# EasyEDA Pro project 小车pcb.epro

# Schematic Schematic1
Board Name: Board1; Create Date: 2025-04-14; Page Name: P1; Project Name: 校赛小车; Schematic Name: Schematic1; Update Date: 2025-05-07; Company: 广师大开拓者ONE; Page Size: A4; Version: V1.0
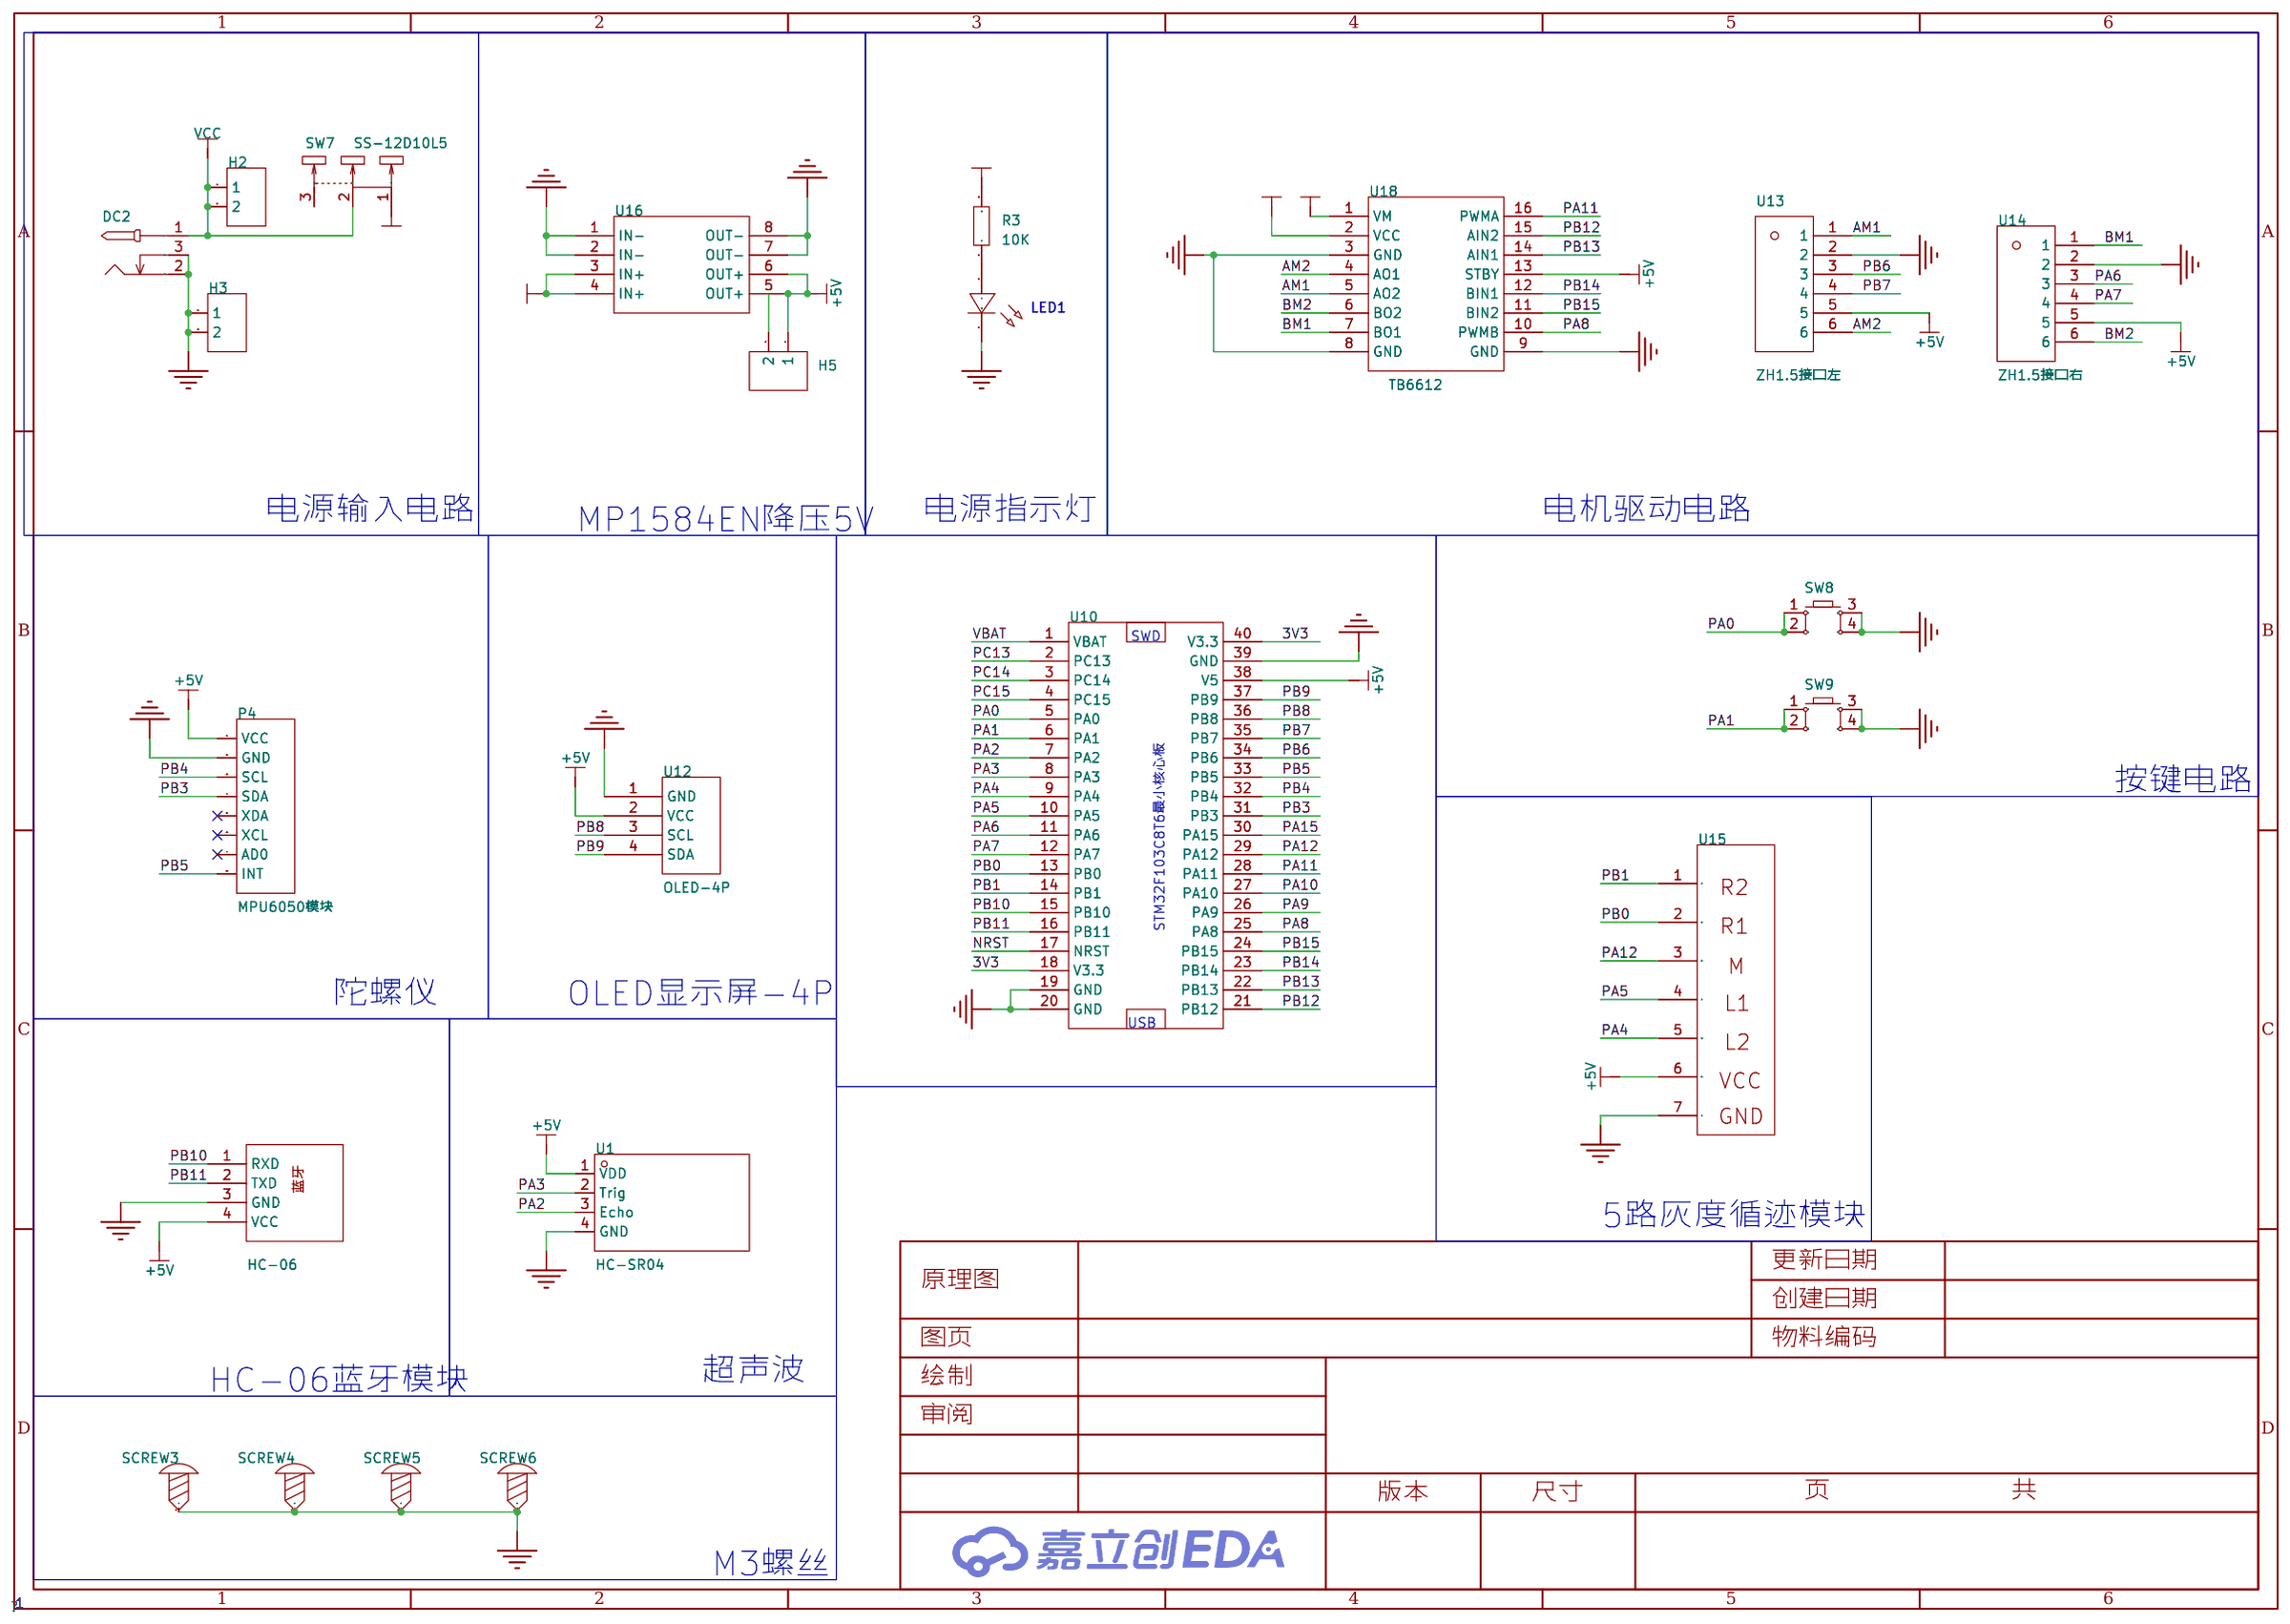
[diagram p0: schematic sheet]

## Parts
DC2  -  [DC-005_2.5]
H2  -  [HDR-TH_2P-P2.54-V-F]
H3  -  [HDR-TH_2P-P2.54-V-F]
H5  -  [HDR-TH_2P-P2.54-V-F]
LED1  -  [LED_0805]
P4  MPU6050模块  [MPU6050模块]
R3  10K  [R0805]
SCREW3  -  [M3螺丝]
SCREW4  -  [M3螺丝]
SCREW5  -  [M3螺丝]
SCREW6  -  [M3螺丝]
SW7  SS-12D10L5  [SW-TH_SS-12D10L5]
SW8  -  [SW-TH_4P-L6.0-W6.0-P4.50-LS6.5]
SW9  -  [SW-TH_4P-L6.0-W6.0-P4.50-LS6.5]
U1  HC-SR04  [HC-SR04]
U10  -  [STM32F103C8T6]
U11  HC-06  [蓝牙-P4-USART]
U12  OLED-4P  [I2C - OLED 0.96" 128X64]
U13  ZH1.5接口左  [ZH1.5*6]
U14  ZH1.5接口右  [ZH1.5*6]
U15  -  [5路灰度传感器]
U16  -  [MP1584EN降压模块]
U18  TB6612  [TB6612电机驱动模块]

## Library data of the parts
DC2 = DC-005_2.5: Supplier Footprint: 插件
H2 H3 H5 = HDR-F_2.54_1x2P: Supplier Part: C49661; Supplier Footprint: 插件
LED1 = LED_0805-G: Supplier Footprint: 0805
P4 = MPU6050模块
R3 = Res_0805: Supplier Footprint: 0805
SCREW3-SCREW6 = M3螺丝: Supplier Footprint: 插件
SW7 = SS-12D10L5: 电路结构:单刀双掷;安装方式:直插;开关颜色:黑色;额定电流(DC):3A;额定电压(DC):125V;额定电流(AC):3A;额定电压(AC):125V;机械寿命:1万次;; LCSC Part Name: 柄长5mm 直插双档 滑动开关; Supplier Part: C319012; Manufacturer: XKB Connectivity(中国星坤); Supplier Footprint: 插件; JLCPCB Part Class: 扩展库; Datasheet: https://atta.szlcsc.com/upload/public/pdf/source/20211009/D6412F37AABE6F9459A6EE7FA4DAEADB.pdf; Supplier: LCSC; Circuit: 单刀双掷; Actuator Style: 矩形柱状; Pin Style: PC引脚; Switch Length: 13mm; Switch Width: 6.8mm; Switch Height: 6.4mm; Mounting Style: 直插; Actuator Color: 黑色; Current Rating (DC): 3A; Voltage Rating (DC): 125V; Current Rating (AC): 3A; Voltage Rating (AC): 125V; Mechanical Life: 1万次; Operating Temperature: -40℃~+85℃
SW8 SW9 = Key_TH_6x6x6: 触点电流:50mA;额定电压(DC):12V;绝缘电阻:100MΩ;电路结构:单刀单掷;安装方式:直插;按钮形状:圆形按钮;按钮/盖帽颜色:黑色;作用力:260gf@±30gf;工作温度:-25℃~+70℃;引脚样式:PC引脚;开关长度:6mm;开关宽度:6mm;开关高度:6mm;带支架:否;; Supplier Part: C2837516; Supplier Footprint: 插件
U1 = HC-SR04: _: 3
U10 = STM32F103C8T6最小核心板
U11 = 蓝牙JDY_31
U12 = OLED-4P
U13 U14 = ZH1.5
U15 = 5路灰度传感器: _: 3
U16 = MP1584EN降压模块: _: 3
U18 = TB6612电机驱动模块

## Nets
3V3: U10.18(V3.3) U10.40(V3.3)
12V: R3.2 SW7.1 U16.3(IN+) U16.4(IN+) U18.1(VM)
+5V: H5.1 H5.2 P4.1(VCC) U1.1(VDD) U10.38(V5) U11.4(VCC) U12.2(VCC) U13.5 U14.5 U15.6 U16.5(OUT+) U16.6(OUT+) U18.2(VCC) U18.13(STBY)
GND: DC2.2 DC2.3 H3.1 H3.2 LED1.1(C) P4.2(GND) SCREW3.1 SCREW4.1 SCREW5.1 SCREW6.1 SW8.3 SW8.4 SW9.3 SW9.4 U1.4(GND) U10.19(GND) U10.20(GND) U10.39(GND) U11.3(GND) U12.1(GND) U13.2 U14.2 U15.7 U16.1(IN-) U16.2(IN-) U16.7(OUT-) U16.8(OUT-) U18.3(GND) U18.8(GND) U18.9(GND)
VBAT: U10.1(VBAT)
VCC: DC2.1(4) H2.1 H2.2 SW7.2
AM1: U13.1 U18.5(AO2)
AM2: U13.6 U18.4(AO1)
BM1: U14.1 U18.7(BO1)
BM2: U14.6 U18.6(BO2)
NRST: U10.17(NRST)
PA0: SW8.1 SW8.2 U10.5(PA0)
PA1: SW9.1 SW9.2 U10.6(PA1)
PA2: U1.3(Echo) U10.7(PA2)
PA3: U1.2(Trig) U10.8(PA3)
PA4: U10.9(PA4) U15.5
PA5: U10.10(PA5) U15.4
PA6: U10.11(PA6) U14.3
PA7: U10.12(PA7) U14.4
PA8: U10.25(PA8) U18.10(PWMB)
PA9: U10.26(PA9)
PA10: U10.27(PA10)
PA11: U10.28(PA11) U18.16(PWMA)
PA12: U10.29(PA12) U15.3
PA15: U10.30(PA15)
PB0: U10.13(PB0) U15.2
PB1: U10.14(PB1) U15.1
PB3: P4.4(SDA) U10.31(PB3)
PB4: P4.3(SCL) U10.32(PB4)
PB5: P4.8(INT) U10.33(PB5)
PB6: U10.34(PB6) U13.3
PB7: U10.35(PB7) U13.4
PB8: U10.36(PB8) U12.3(SCL)
PB9: U10.37(PB9) U12.4(SDA)
PB10: U10.15(PB10) U11.1(RXD)
PB11: U10.16(PB11) U11.2(TXD)
PB12: U10.21(PB12) U18.15(AIN2)
PB13: U10.22(PB13) U18.14(AIN1)
PB14: U10.23(PB14) U18.12(BIN1)
PB15: U10.24(PB15) U18.11(BIN2)
PC13: U10.2(PC13)
PC14: U10.3(PC14)
PC15: U10.4(PC15)
$1N9017: LED1.2(A) R3.1

Not connected (* = marked no-connect by the designer): P4 5(XDA)* 6(XCL)* 7(AD0)*; SW7 3

## Notes on the sheet
- 电源输入电路
- 电源指示灯
- 电机驱动电路
- MP1584EN降压5V
- 按键电路
- 陀螺仪
- OLED显示屏-4P
- 5路灰度循迹模块
- 超声波
- HC-06蓝牙模块
- M3螺丝

# Board PCB1
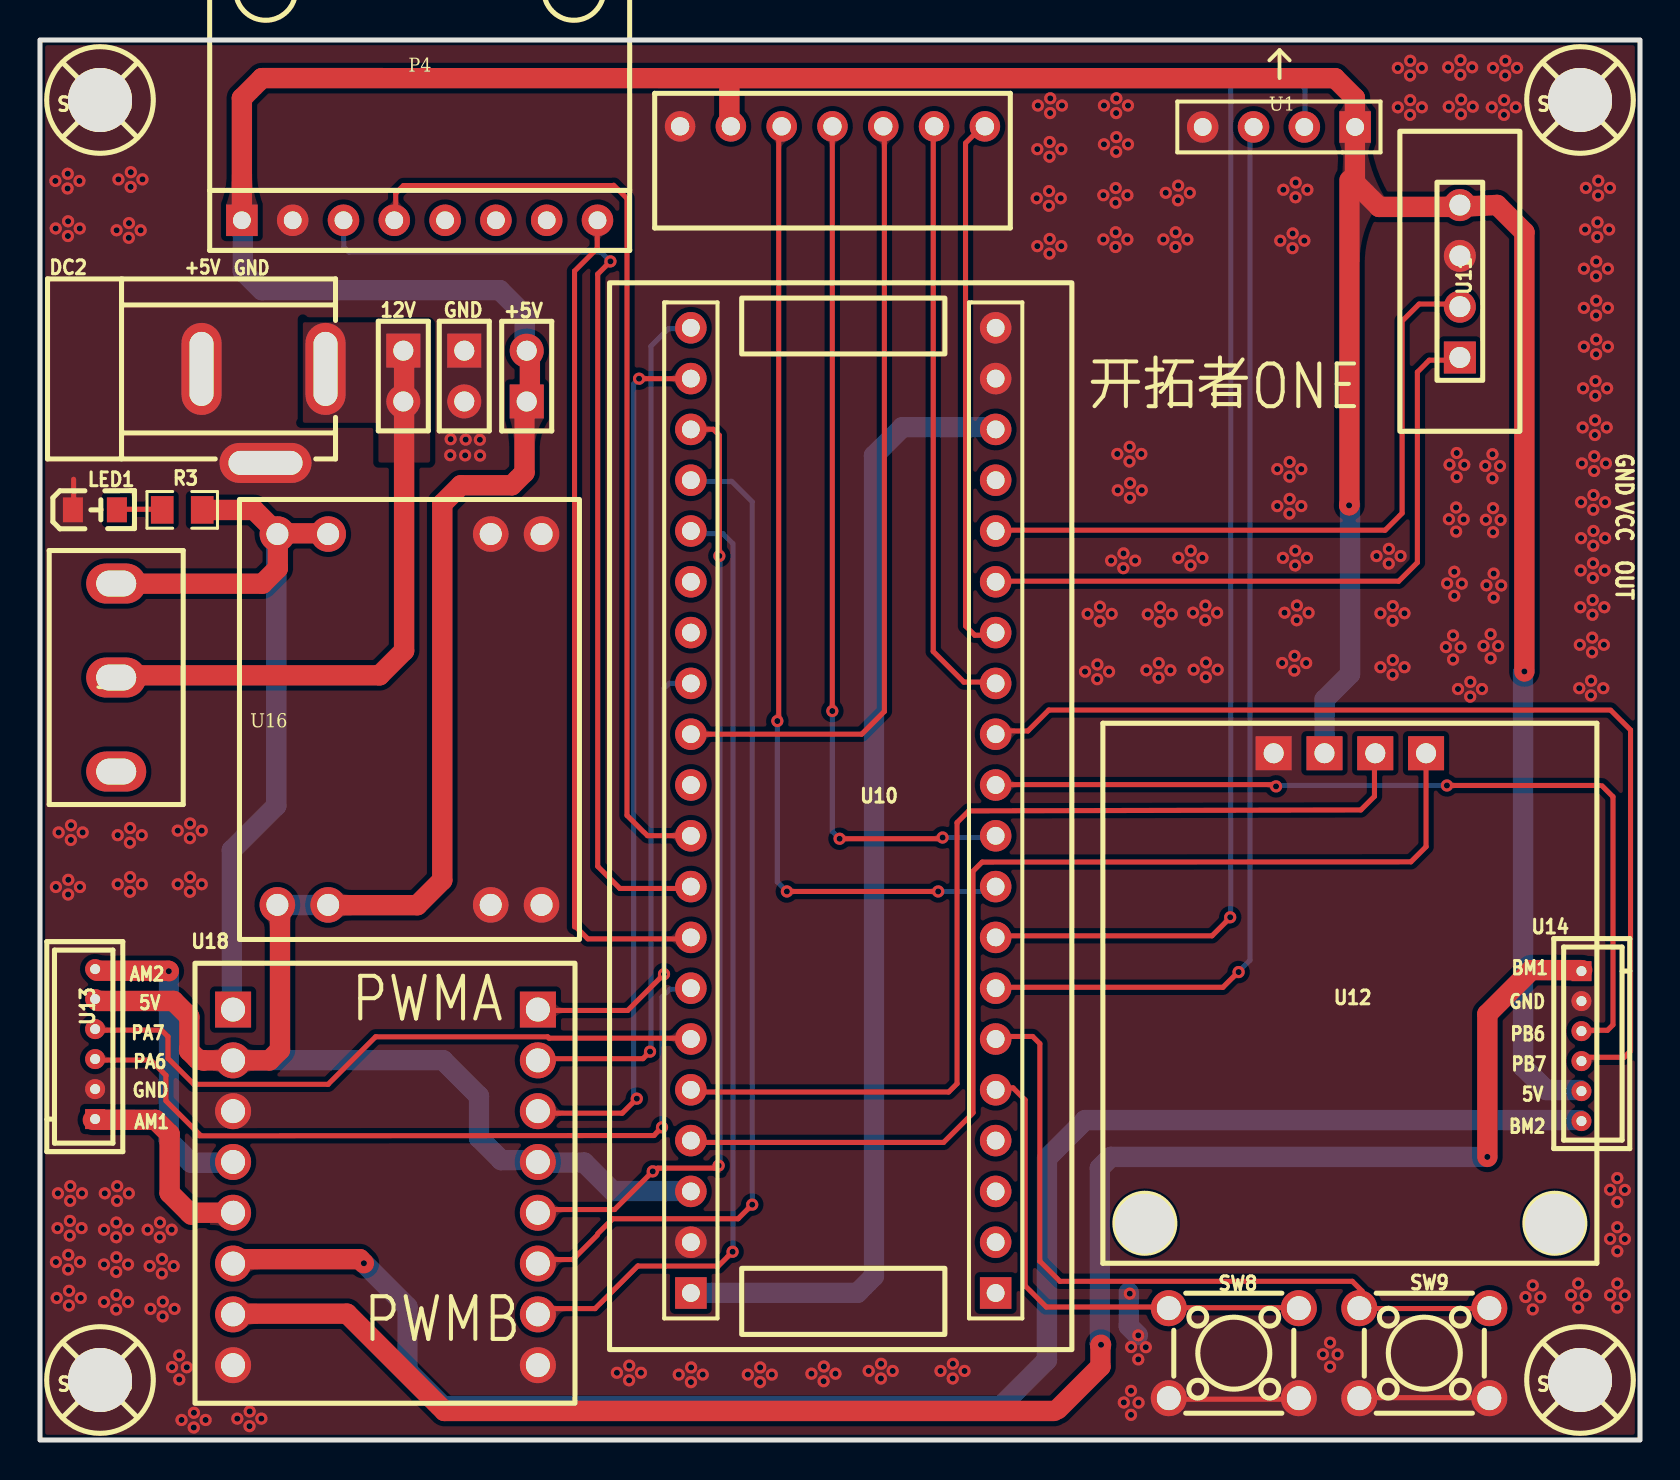
[diagram p1: board, top side]
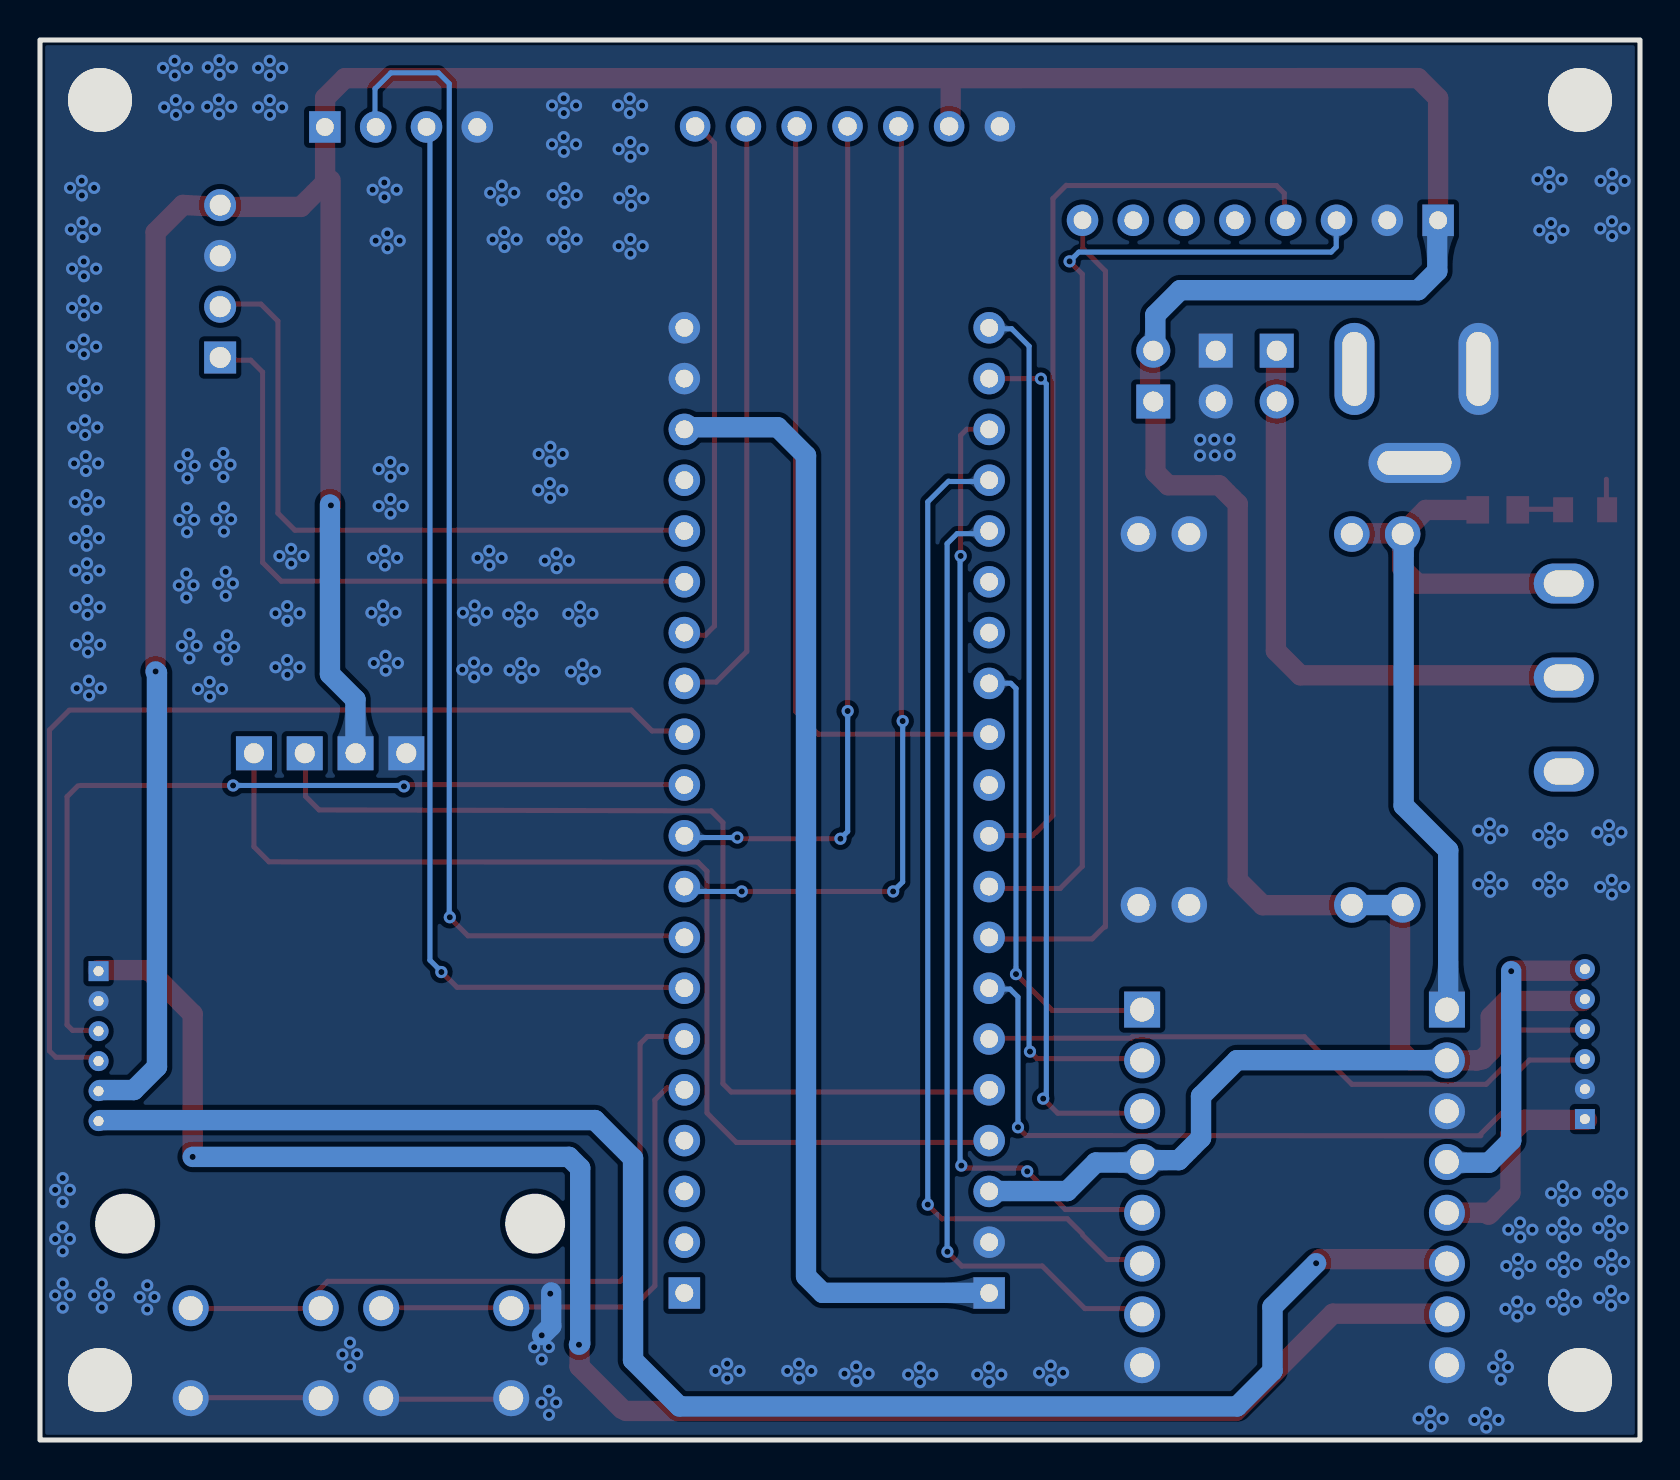
[diagram p2: board, bottom side, seen from below]

Outline 80 x 70 mm; copper layers: Top Layer, Bottom Layer. Coordinates in mm from the lower left corner of the outline.
Outline path: rectangle 0,70 80,0
Stack: Top Layer 0.035mm / Dielectric1 1.51mm FR4 er 4.5 / Bottom Layer 0.035mm

## Design rules (mm)
template: 自定义配置
spacing copperThickness1oz (default): track to track 0.102, other pairs 0.152 to 0.3
spacing copperThickness2oz: track to track 0.203, other pairs 0.152 to 0.3
track width copperThickness1oz (default): min 0.127, default 0.254, max 2.54
track width copperThickness2oz: min 0.203, default 0.254, max 2.54
track width 加粗: min 0.127, default 1.016, max 2.54
differential pair differentialPair (default): width min 0.127, default 0.254, max 2.54; gap min 0.152, default 0.152
via viaSize (default): diameter min 0.5, default 0.61, max 10; hole min 0.3, default 0.305, max 6.299
net 3V3 uses 加粗
net VBAT uses 加粗
net VCC uses 加粗
net GND uses 加粗
net +5V uses 加粗

## Placement (name value [footprint] x y rotation side)
12V  -  [HDR-TH_2P-P2.54-V-F]  18.17 53.2 270 top
+5V  -  [HDR-TH_2P-P2.54-V-F]  24.34 53.19 90 top
DC2  -  [DC-005_2.5]  11.05 53.24 180 top
GND  -  [HDR-TH_2P-P2.54-V-F]  21.21 53.2 270 top
LED1  -  [LED_0805]  2.79 46.5 0 top
P4  -  [MPU6050模块]  27.87 60.99 90 top
R3  10K  [R0805]  7.11 46.5 0 top
SCREW3  -  [M3螺丝]  77 67 0 top
SCREW4  -  [M3螺丝]  77 3 0 top
SCREW5  -  [M3螺丝]  3 67 0 top
SCREW6  -  [M3螺丝]  3 3 0 top
SW7  SS-12D10L5  [SW-TH_SS-12D10L5]  3.81 38.12 270 top
SW8  -  [SW-TH_4P-L6.0-W6.0-P4.50-LS6.5]  59.69 4.34 0 top
SW9  -  [SW-TH_4P-L6.0-W6.0-P4.50-LS6.5]  69.22 4.34 0 top
U1  -  [HC-SR04]  61.98 65.68 180 top
U10  -  [STM32F103C8T6]  47.78 31.44 180 top
U11  HC-06  [蓝牙-P4-USART]  70.99 57.94 90 top
U12  OLED-4P  [I2C - OLED 0.96" 128X64]  53.14 35.84 0 top
U13  ZH1.5接口左  [ZH1.5*6]  2.76 16.05 180 top
U14  ZH1.5接口右  [ZH1.5*6]  77.07 23.44 0 top
U15  -  [5路灰度传感器]  39.62 63.65 270 top
U16  -  [MP1584EN降压模块]  18.47 36.03 270 top
U18  TB6612  [TB6612电机驱动模块]  7.75 23.84 0 top

## Footprints (pads in the part's own frame, mm; a bottom-side part is the same pattern mirrored in y, then rotated)
5路灰度传感器
  round 1.524 hole 0.914: 1(-2.032,7.62) 2(-2.032,5.08) 3(-2.032,2.54) 4(-2.032,0) 5(-2.032,-2.54) 6(-2.032,-5.08) 7(-2.032,-7.62)
DC-005_2.5
  oval 2x4.6 hole 1.2x3.7: 1(-3.227,-0.318) 2(2.973,-0.318)
  oval 4.6x2 hole 3.7x1.2: 3(-0.227,4.382)
HC-SR04
  rect 1.575x1.575 hole 0.889: 1(-3.78,0.03)
  round 1.575 hole 0.889: 2(-1.24,0.03) 3(1.3,0.03) 4(3.84,0.03)
HDR-TH_2P-P2.54-V-F
  rect 1.7x1.7 hole 1: 1(-1.27,0)
  round 1.7 hole 1: 2(1.27,0)
I2C - OLED 0.96" 128X64
  rect 1.8x1.7 hole 1: 1(8.54,-1.5) 2(11.08,-1.5) 3(13.62,-1.5) 4(16.16,-1.5)
LED_0805
  rect 1x1.25 smd: 1(-1.15,0.005) 2(1.05,0.005)
M3螺丝
  round 3.2 hole 3.2: 1(0,0)
MP1584EN降压模块
  round 1.778 hole 1.1: 1(-9.271,6.604) 2(-9.271,4.064) 3(-9.271,-4.064) 4(-9.271,-6.604) 5(9.271,-6.604) 6(9.271,-4.064) 7(9.271,4.064) 8(9.271,6.604)
MPU6050模块
  rect 1.575x1.575 hole 0.889: 1(0,17.78)
  round 1.575 hole 0.889: 2(0,15.24) 3(0,12.7) 4(0,10.16) 5(0,7.62) 6(0,5.08) 7(0,2.54) 8(0,0)
R0805
  rect 1.133x1.377 smd: 1(-1,0) 2(1,0)
STM32F103C8T6
  rect 1.575x1.575 hole 0.889: 1(0,24.093) 40(15.24,24.093)
  round 1.575 hole 0.889: 2(0,21.553) 3(0,19.013) 4(0,16.473) 5(0,13.933) 6(0,11.393) 7(0,8.853) 8(0,6.313) 9(0,3.773) 10(0,1.233) 11(0,-1.307) 12(0,-3.847) 13(0,-6.387) 14(0,-8.927) 15(0,-11.467) 16(0,-14.007) 17(0,-16.547) 18(0,-19.087) 19(0,-21.627) 20(0,-24.167) 21(15.24,-24.167) 22(15.24,-21.627) 23(15.24,-19.087) 24(15.24,-16.547) 25(15.24,-14.007) 26(15.24,-11.467) 27(15.24,-8.927) 28(15.24,-6.387) 29(15.24,-3.847) 30(15.24,-1.307) 31(15.24,1.233) 32(15.24,3.773) 33(15.24,6.313) 34(15.24,8.853) 35(15.24,11.393) 36(15.24,13.933) 37(15.24,16.473) 38(15.24,19.013) 39(15.24,21.553)
SW-TH_4P-L6.0-W6.0-P4.50-LS6.5
  round 1.8 hole 1.2: 1(-3.25,2.25) 2(3.25,2.25) 3(-3.25,-2.25) 4(3.25,-2.25)
SW-TH_SS-12D10L5
  oval 2x3 hole 1.3x2: 1(-4.7,0) 2(0,0) 3(4.7,0)
TB6612电机驱动模块
  rect 1.8x1.8 hole 1.2: 1(1.905,-2.315) 16(17.145,-2.315)
  round 1.8 hole 1.2: 2(1.905,-4.855) 3(1.905,-7.395) 4(1.905,-9.935) 5(1.905,-12.475) 6(1.905,-15.015) 7(1.905,-17.555) 8(1.905,-20.095) 9(17.145,-20.095) 10(17.145,-17.555) 11(17.145,-15.015) 12(17.145,-12.475) 13(17.145,-9.935) 14(17.145,-7.395) 15(17.145,-4.855)
ZH1.5*6
  rect 1x1 hole 0.5: 1(0,0)
  round 1 hole 0.5: 2(0,-1.498) 3(0,-3) 4(0,-4.498) 5(0,-6) 6(0,-7.498)
蓝牙-P4-USART
  rect 1.6x1.6 hole 1.05: 1(-3.81,0)
  round 1.6 hole 1.05: 2(-1.27,0) 3(1.27,0) 4(3.81,0)

## Nets
As in the schematic, except:
+5V: +5V.1 +5V.2 P4.1 U1.1 U10.38 U11.4 U12.2 U13.5 U14.5 U15.6 U16.5 U16.6 U18.2 U18.13
GND: DC2.2 DC2.3 GND.1 GND.2 LED1.1 P4.2 SCREW3.1 SCREW4.1 SCREW5.1 SCREW6.1 SW8.3 SW8.4 SW9.3 SW9.4 U1.4 U10.19 U10.20 U10.39 U11.3 U12.1 U13.2 U14.2 U15.7 U16.1 U16.2 U16.7 U16.8 U18.3 U18.8 U18.9
VCC: 12V.1 12V.2 DC2.1 SW7.2

Pads without a net: P4 5 6 7; SW7 3

## Via types
v1: diameter 0.61, hole 0.305, Top Layer to Bottom Layer, 422 vias

## Routing (per net, layer and track width the routed paths; a pad name or vN(x,y) marks a point on that pad's centre or on a via; arc(x,y) is an arc through that point)
3V3: length 56.9
  Bottom Layer w1.016: 47.59,50.64 43.12,50.64 41.7,49.22 41.7,8.19 ; 32.63,7.36 40.87,7.36 41.68,8.17
12V: length 41
  Top Layer w1.016: 8.18,46.5 10.71,46.5 11.89,45.32 ; 14.36,45.31 14.33,45.33 11.89,45.33 ; 11.89,45.05 11.89,43.58 11.12,42.82 4.26,42.82 4.11,42.96
  Bottom Layer w1.016: 9.68,21.63 9.59,21.72 9.59,29.49 11.82,31.72 11.82,45.35
+5V: length 256.3
  Top Layer w1.016: 24.49,52.12 24.49,54.48 ; 70.95,61.65 70.96,61.66 72.85,61.75 74.22,60.39 v1(74.22,38.43) ; 70.95,61.65 70.96,61.65 ; 70.95,61.65 66.96,61.65 65.77,62.84 ; 7.47,19.64 7.47,21.16 6.68,21.95 2.86,21.95 ; 11.82,26.9 12,26.72 12,19.51 11.47,18.98 U18.2 8.19,18.98 ; 65.74,65.86 65.74,67.1 64.75,68.09 11.1,68.09 10.09,67.09 P4.1 ; 7.45,19.55 7.45,19.46 7.88,19.04 8.19,18.98 ; 24.34,51.97 24.32,51.99 ; 65.74,65.63 65.74,62.99 ; 14.36,26.74 18.86,26.74 20.11,27.99 20.11,46.81 21.04,47.74 23.59,47.74 24.23,48.37 24.23,51.86 24.14,51.77 ; 34.5,67.95 34.47,67.92 34.47,65.71 ; v1(65.45,46.73) 65.47,46.75 65.47,62.99 ; 71.03,61.73 71.05,61.75 ; 8.19,18.98 8.12,18.98
  Bottom Layer w1.016: 11.72,26.75 14.32,26.75 14.47,26.9 ; v1(74.22,38.43) 74.15,38.36 74.15,18.66 75.31,17.5 77.01,17.5 ; 32.63,12.36 32.54,12.45 28.63,12.45 27.21,13.87 25.09,13.87 ; 9.61,18.99 20.15,18.99 21.95,17.19 21.95,15.1 23.06,13.99 24.85,13.99 ; 24.23,54.48 24.23,56.25 22.99,57.49 11.09,57.49 10.14,58.45 10.14,60.94 P4.1 ; 64.2,34.33 64.23,34.36 64.23,37.02 65.5,38.29 65.5,46.78
GND: length 17.1
  Top Layer w0.254: 56.17,2.04 62.78,2.04 62.86,2.12 ; 65.88,2.12 72.34,2.12 ; 1.86,46.54 1.68,46.71 1.68,48.03
  Bottom Layer w1.016: 54.9,5.24 54.44,5.7 54.44,7.38
  vias: v1(0.77,62.95) v1(0.78,60.58) v1(0.8,27.65) v1(0.8,8.9) v1(0.84,7.1) v1(0.93,30.38) v1(0.9,12.33) v1(0.88,10.6) v1(1.39,63.31) v1(1.38,62.58) v1(1.4,60.94) v1(1.4,60.2) v1(1.41,28.01) v1(1.41,27.27) v1(1.42,9.26) v1(1.41,8.52) v1(1.45,6.72) v1(1.54,30) v1(1.52,12.69) v1(1.51,11.96) v1(1.5,10.96) v1(1.49,10.22) v1(1.46,7.46) v1(1.55,30.74) v1(1.97,62.95) v1(1.99,60.58) v1(2,27.65) v1(2,8.9) v1(2.04,7.1) v1(2.13,30.38) v1(2.1,12.33) v1(2.08,10.6) v1(3.24,12.33) v1(3.2,10.51) v1(3.2,8.78) v1(3.2,6.9) v1(3.83,60.49) v1(3.85,11.96) v1(3.82,10.87) v1(3.81,10.14) v1(3.82,9.14) v1(3.81,8.4) v1(3.82,7.26) v1(3.81,6.52) v1(3.92,63.03) v1(3.89,30.24) v1(3.89,27.79) v1(3.86,12.69) v1(4.45,60.84) v1(4.44,60.11) v1(4.44,12.33) v1(4.4,10.51) v1(4.4,8.78) v1(4.4,6.9) v1(4.54,63.39) v1(4.53,62.65) v1(4.5,30.6) v1(4.5,29.86) v1(4.5,28.15) v1(4.5,27.41) v1(5.03,60.49) v1(5.12,63.03) v1(5.09,30.24) v1(5.09,27.79) v1(5.38,10.51) v1(5.48,8.7) v1(5.52,6.56) v1(6,10.87) v1(5.99,10.14) v1(6.1,9.06) v1(6.09,8.32) v1(6.14,6.92) v1(6.13,6.18) v1(6.58,10.51) v1(6.6,3.65) v1(6.69,8.7) v1(6.72,6.56) v1(6.89,30.47) v1(6.89,27.79) v1(6.96,4.23) v1(6.96,3.03) v1(7.08,1) v1(7.34,3.64) v1(7.5,30.83) v1(7.5,30.09) v1(7.5,28.15) v1(7.5,27.41) v1(7.7,1.36) v1(7.69,0.62) v1(8.09,30.47) v1(8.09,27.79) v1(8.28,1) v1(9.86,1.07) v1(10.48,1.43) v1(10.48,0.69) v1(11.07,1.07) v1(20.53,50.04) v1(20.51,49.24) v1(21.28,50.02) v1(21.26,49.23) v1(21.99,50.01) v1(22,49.22) v1(28.84,3.36) v1(29.46,3.72) v1(29.46,2.98) v1(30.05,3.36) v1(31.94,3.27) v1(32.55,2.89) v1(32.56,3.63) v1(33.14,3.27) v1(35.39,3.27) v1(36.01,3.63) v1(36,2.89) v1(36.59,3.27) v1(38.57,3.32) v1(39.19,3.68) v1(39.18,2.94) v1(39.77,3.32) v1(41.43,3.45) v1(42.04,3.08) v1(42.05,3.81) v1(42.64,3.45) v1(45.02,3.45) v1(45.64,3.81) v1(45.63,3.08) v1(46.23,3.45) v1(49.83,62.09) v1(49.9,66.72) v1(49.86,64.54) v1(49.86,59.69) v1(50.44,61.71) v1(50.51,67.08) v1(50.51,66.35) v1(50.48,64.9) v1(50.47,64.17) v1(50.45,62.45) v1(50.48,60.05) v1(50.47,59.32) v1(51.04,62.09) v1(51.1,66.72) v1(51.07,64.54) v1(51.07,59.69) v1(52.25,38.42) v1(52.38,41.31) v1(52.87,38.78) v1(52.86,38.04) v1(53,41.66) v1(52.99,40.93) v1(53.2,66.72) v1(53.2,64.78) v1(53.17,62.24) v1(53.17,60.03) v1(53.45,38.42) v1(53.56,43.97) v1(53.58,41.31) v1(53.82,67.08) v1(53.81,66.35) v1(53.82,65.14) v1(53.81,64.41) v1(53.79,62.6) v1(53.78,61.86) v1(53.79,60.39) v1(53.78,59.65) v1(53.86,49.3) v1(53.89,47.49) v1(54.18,44.33) v1(54.17,43.59) v1(54.19,1.88) v1(54.4,66.72) v1(54.4,64.78) v1(54.37,62.24) v1(54.37,60.03) v1(54.48,49.66) v1(54.47,48.92) v1(54.51,47.84) v1(54.5,47.11) v1(54.49,7.32) v1(54.55,4.65) v1(54.55,2.46) v1(54.55,1.26) v1(54.76,43.97) v1(54.91,5.23) v1(54.91,4.03) v1(54.93,1.87) v1(55.07,49.3) v1(55.09,47.49) v1(55.32,38.49) v1(55.29,4.64) v1(55.39,41.28) v1(55.94,38.85) v1(55.93,38.11) v1(56.01,41.64) v1(56,40.91) v1(56.17,60.03) v1(56.29,62.36) v1(56.52,38.49) v1(56.59,41.28) v1(56.79,60.39) v1(56.78,59.65) v1(56.91,62.72) v1(56.9,61.98) v1(56.92,44.11) v1(57.37,60.03) v1(57.49,62.36) v1(57.54,44.47) v1(57.53,43.73) v1(57.65,41.36) v1(57.68,38.52) v1(58.12,44.11) v1(58.27,41.72) v1(58.26,40.99) v1(58.3,38.88) v1(58.29,38.14) v1(58.85,41.36) v1(58.88,38.52) v1(61.86,48.54) v1(61.86,46.7) v1(62.01,59.97) v1(62.15,44.11) v1(62.1,38.85) v1(62.17,62.51) v1(62.23,41.36) v1(62.48,48.9) v1(62.47,48.17) v1(62.48,47.06) v1(62.47,46.32) v1(62.63,60.33) v1(62.62,59.59) v1(62.72,39.21) v1(62.72,38.47) v1(62.78,62.87) v1(62.78,62.14) v1(62.76,44.47) v1(62.76,43.73) v1(62.85,41.72) v1(62.84,40.99) v1(63.07,48.54) v1(63.07,46.7) v1(63.22,59.97) v1(63.35,44.11) v1(63.31,38.85) v1(63.37,62.51) v1(63.43,41.36) v1(64.14,4.29) v1(64.5,4.87) v1(64.5,3.67) v1(64.88,4.28) v1(66.83,44.2) v1(67.02,41.34) v1(67.02,38.64) v1(67.45,44.56) v1(67.44,43.82) v1(67.64,41.69) v1(67.63,40.96) v1(67.64,39) v1(67.63,38.26) v1(67.89,68.6) v1(67.89,66.63) v1(68.03,44.2) v1(68.22,41.34) v1(68.22,38.64) v1(68.51,68.96) v1(68.5,68.23) v1(68.51,66.99) v1(68.5,66.26) v1(69.09,68.6) v1(69.09,66.63) v1(70.29,39.65) v1(70.41,68.63) v1(70.44,66.66) v1(70.45,46.04) v1(70.35,42.83) v1(70.48,48.77) v1(70.71,43.41) v1(70.71,42.21) v1(70.65,40.23) v1(70.65,39.03) v1(70.84,49.35) v1(70.84,48.15) v1(70.81,46.62) v1(70.81,45.42) v1(70.9,37.55) v1(71.03,68.99) v1(71.02,68.26) v1(71.05,66.29) v1(71.03,39.64) v1(71.06,67.02) v1(71.09,42.82) v1(71.21,48.76) v1(71.18,46.03) v1(71.52,37.91) v1(71.51,37.17) v1(71.61,68.63) v1(71.64,66.66) v1(72.1,37.55) v1(72.17,39.71) v1(72.26,48.71) v1(72.29,46.01) v1(72.32,42.74) v1(72.53,40.29) v1(72.53,39.09) v1(72.65,68.6) v1(72.59,66.63) v1(72.62,49.29) v1(72.62,48.09) v1(72.65,46.59) v1(72.65,45.39) v1(72.68,43.32) v1(72.68,42.12) v1(72.91,39.7) v1(73,48.7) v1(73.03,46) v1(73.06,42.73) v1(73.21,66.99) v1(73.2,66.26) v1(73.27,68.96) v1(73.26,68.23) v1(73.79,66.63) v1(73.85,68.6) v1(74.28,7.15) v1(74.64,7.73) v1(74.64,6.53) v1(75.01,7.14) v1(76.55,7.24) v1(76.91,7.82) v1(76.91,6.62) v1(77.03,43.48) v1(77.01,41.64) v1(76.99,39.76) v1(76.96,37.59) v1(77.13,50.63) v1(77.09,48.83) v1(77.05,46.89) v1(77.05,45.09) v1(77.19,58.56) v1(77.19,56.61) v1(77.19,54.67) v1(77.15,52.59) v1(77.29,62.61) v1(77.25,60.52) v1(77.29,7.23) v1(77.55,37.23) v1(77.64,43.1) v1(77.63,42) v1(77.62,41.26) v1(77.61,40.12) v1(77.6,39.38) v1(77.56,37.97) v1(77.74,50.25) v1(77.71,49.19) v1(77.7,48.45) v1(77.67,47.25) v1(77.66,46.51) v1(77.67,45.45) v1(77.66,44.72) v1(77.65,43.84) v1(77.81,58.92) v1(77.8,58.19) v1(77.81,56.97) v1(77.8,56.23) v1(77.81,55.03) v1(77.8,54.29) v1(77.77,52.94) v1(77.76,52.21) v1(77.75,50.99) v1(77.91,62.96) v1(77.91,62.23) v1(77.87,60.88) v1(77.87,60.15) v1(78.24,43.48) v1(78.22,41.64) v1(78.19,39.76) v1(78.17,37.59) v1(78.34,50.63) v1(78.3,48.83) v1(78.26,46.89) v1(78.26,45.09) v1(78.4,58.56) v1(78.4,56.61) v1(78.4,54.67) v1(78.36,52.59) v1(78.5,62.61) v1(78.46,60.52) v1(78.51,12.51) v1(78.51,10.06) v1(78.51,7.24) v1(78.86,13.1) v1(78.86,11.89) v1(78.86,10.64) v1(78.86,9.44) v1(78.86,7.82) v1(78.86,6.62) v1(79.24,12.5) v1(79.24,10.05) v1(79.24,7.23)
VCC: length 30.2
  Top Layer w1.016: 17.99,54.36 18.21,54.14 18.21,39.46 16.98,38.23 3.53,38.23
AM1: length 10.8
  Top Layer w1.016: 7.57,11.26 6.48,12.35 6.48,15.3 5.77,16.01 2.64,16.01 ; 7.47,11.36 U18.5
AM2: length 15.8
  Top Layer w1.016: 2.84,23.46 6.42,23.46 v1(6.44,23.44)
  Bottom Layer w1.016: 9.69,13.87 7.55,13.87 6.44,14.98 v1(6.44,23.44) ; 9.62,13.87 U18.4
BM1: length 88.5
  Top Layer w1.016: 77.11,23.49 74.56,23.49 72.37,21.3 v1(72.37,14.16) ; v1(53.05,4.76) 53.02,4.73 53.02,3.67 50.89,1.54 ; 9.63,6.32 15.35,6.32 20.22,1.45 50.71,1.45
  Bottom Layer w1.016: v1(72.37,14.16) 53.55,14.16 52.99,13.59 52.99,4.82 v1(53.05,4.76)
BM2: length 84.1
  Top Layer w1.016: 9.72,9.04 15.99,9.04 v1(16.19,8.84)
  Bottom Layer w1.016: 77,16 52.26,16 50.35,14.09 50.35,4 48.03,1.68 20.15,1.68 18.38,3.45 18.38,6.66 v1(16.19,8.84)
PA0: length 25.2
  Top Layer w0.254: 62.74,6.61 56.36,6.61 ; 56.62,6.31 56.34,6.59 56.3,6.63 ; 56.28,6.65 50.31,6.65 49.26,7.71 49.26,17 48.65,17.61 47.86,17.61
PA1: length 37.4
  Top Layer w0.254: 66.11,6.61 66.11,7.44 65.62,7.93 50.99,7.93 49.99,8.94 49.99,19.82 49.63,20.18 47.82,20.18 ; 72.49,6.57 65.96,6.57 65.92,6.61
PA2: length 55.7
  Top Layer w0.254: 59.98,23.45 59.96,23.45 59.15,22.64 47.5,22.64
  Bottom Layer w0.254: 59.89,23.38 60.5,23.99 60.5,65.67 60.73,65.9
  vias: v1(59.93,23.4)
PA3: length 60
  Top Layer w0.254: 59.54,26.15 58.6,25.21 47.72,25.21
  Bottom Layer w0.254: 63.25,65.71 63.25,67.56 62.46,68.36 60.08,68.36 59.54,67.82 59.54,26.15
  vias: v1(59.51,26.14)
PA4: length 49.4
  Top Layer w0.254: 36.93,66.08 36.93,36.02 v1(36.87,35.95) ; v1(37.34,27.43) v1(44.91,27.43)
  Bottom Layer w0.254: v1(37.34,27.43) 36.87,27.9 v1(36.87,35.95) ; 47.77,27.65 47.55,27.43 v1(44.91,27.43)
PA5: length 43.6
  Top Layer w0.254: v1(45.13,30.12) 45.07,30.06 v1(39.98,30.06) ; 39.62,65.9 v1(39.62,36.45)
  Bottom Layer w0.254: 47.58,30.06 47.52,30.12 v1(45.13,30.12) ; v1(39.62,36.45) 39.62,30.43 v1(39.98,30.06)
PA6: length 44.4
  Top Layer w0.254: 76.97,20.48 78.38,20.48 78.65,20.76 78.65,32.17 78.1,32.71 ; 47.58,32.77 61.71,32.77 v1(61.8,32.68) ; 77.98,32.73 v1(70.35,32.73)
  Bottom Layer w0.254: v1(61.8,32.68) 61.85,32.73 v1(70.35,32.73)
PA7: length 50.9
  Top Layer w0.254: 47.8,35.45 49.39,35.45 50.44,36.5 78.53,36.5 ; 78.55,36.47 79.53,35.5 79.53,19.45 79.21,19.14 77.3,19.14
PA8: length 48.7
  Top Layer w0.254: 29.9,8.7 33.91,8.7 v1(34.63,9.41) ; 24.69,6.57 27.75,6.57 29.89,8.71
  Bottom Layer w0.254: 34.64,9.5 34.64,44.82 34.15,45.32 32.74,45.32 32.6,45.45
PA11: length 22.8
  Top Layer w0.254: v1(31.2,23.29) 29.38,21.48 24.74,21.48
  Bottom Layer w0.254: 32.42,37.84 31.46,37.84 31.2,37.58 v1(31.2,23.29)
PA12: length 39.6
  Top Layer w0.254: 42.32,65.88 42.22,65.77 42.22,36.43 41.08,35.29 32.61,35.29
PB0: length 30.6
  Top Layer w0.254: 44.66,65.95 44.66,39.43 46.19,37.9 48.15,37.9
PB1: length 27
  Top Layer w0.254: 47.04,65.61 46.28,64.84 46.28,40.7 46.74,40.24 47.84,40.24
PB3: length 47.6
  Top Layer w0.254: 17.78,61.17 17.78,62.33 18.17,62.72 28.67,62.72 ; 30.23,30.36 30.38,30.22 32.64,30.22 ; 30.18,30.41 29.35,31.23 29.35,62.07 28.68,62.74
PB4: length 50.5
  Top Layer w0.254: v1(28.52,58.93) 27.89,58.3 27.89,28.68 28.99,27.58 32.48,27.58
  Bottom Layer w0.254: P4.3 15.19,60.97 15.19,59.65 15.44,59.39 28.06,59.39 v1(28.52,58.93)
PB5: length 41.8
  Top Layer w0.254: 26.76,25.69 27.39,25.06 32.73,25.06 ; 26.73,25.65 26.73,58.45 27.86,59.58 27.86,60.73
PB6: length 39
  Top Layer w0.254: 8.03,15.23 6.3,16.96 6.3,18.23 5.53,19 2.76,19 ; 31.12,15.66 v1(31.1,15.64) 30.7,15.23 ; 30.71,15.22 7.96,15.21
  Bottom Layer w0.254: v1(31.1,15.64) 31.1,22.15 31.5,22.54 32.49,22.54 32.53,22.57
PB7: length 32.6
  Top Layer w0.254: 14.41,17.79 16.78,20.16 25.38,20.16 25.45,20.09 32.46,20.09 ; 14.41,17.78 7.69,17.78 6.4,19.08 6.4,20.17 6.08,20.49 2.68,20.49
PB8: length 49.8
  Top Layer w0.254: U12.3 66.72,34.3 ; 32.63,17.4 45.44,17.4 45.85,17.82 45.85,30.87 46.44,31.46 66.04,31.5 66.72,32.18 66.72,34.07
PB9: length 54.6
  Top Layer w0.254: 46.65,16.39 46.65,28.44 47.11,28.89 68.55,28.91 69.3,29.66 U12.4 ; 46.65,16.35 45.18,14.88 32.56,14.88
PB10: length 33.6
  Top Layer w0.254: 47.62,42.94 67.93,42.94 68.87,43.87 68.87,53.4 69.46,53.99 70.91,53.99 70.99,54.08
PB11: length 33.9
  Top Layer w0.254: 47.45,45.49 67.25,45.49 68.1,46.34 68.1,55.95 68.95,56.8 70.99,56.8
PB12: length 43.5
  Top Layer w0.254: v1(30.5,19.42) 30.15,19.07 24.78,19.07
  Bottom Layer w0.254: v1(30.5,19.42) 30.54,19.46 30.54,54.69 31.42,55.56 32.55,55.56
PB13: length 44.2
  Top Layer w0.254: 32.68,53.07 32.68,53.07 v1(29.95,53.07) ; v1(29.84,17.07) 29.11,16.34 24.83,16.34
  Bottom Layer w0.254: v1(29.84,17.07) 29.68,17.22 29.68,52.8 v1(29.95,53.07)
PB14: length 47.8
  Top Layer w0.254: v1(33.97,44.2) 33.97,50.23 33.66,50.54 32.72,50.54 ; v1(33.93,13.72) 33.8,13.59 30.89,13.59 30.7,13.4 ; v1(30.64,13.43) 28.73,11.52 24.87,11.52
  Bottom Layer w0.254: 34,13.75 34,44.17 v1(33.97,44.2)
PB15: length 50
  Top Layer w0.254: 27.89,10.31 28.63,11.06 34.91,11.06 v1(35.61,11.77) ; 27.87,10.25 26.64,9.02 25.37,9.02
  Bottom Layer w0.254: v1(35.61,11.77) 35.61,46.91 34.57,47.95 ; 34.55,47.92 32.63,47.92 32.55,48.01
$1N9017: length 2.2
  Top Layer w0.254: 3.8,46.54 6,46.54

## Copper pours and planes (outline as drawn; the poured copper is in the pictures)
GND on Top Layer: -12.12,79.97 95.04,79.97 95.04,-8.67 -12.12,-8.67
GND on Top Layer: 20.02,55.89 22.47,55.89 22.47,48.68 20.02,48.68
GND on Bottom Layer: -15.12,80.63 96.88,80.63 96.88,-8.67 -15.12,-8.67
VCC on Top Layer: 13.28,55.88 13.14,56.02 13.14,50.94 13.06,50.86 16.88,50.86 16.92,50.82 16.92,48.87 19.47,48.87 19.51,48.91 19.51,55.81 19.43,55.88

Small or netless copper shapes (teardrops, artwork), in the pictures only: 65 on Top Layer, 40 on Bottom Layer

## Text on the board
Top Silkscreen Layer: AM2 | PA7 | GND | PA6 | AM1 | 5V | +5V | BM2 | PB6 | PB7 | BM1 | VCC | OUT | PWMA | PWMB | 开拓者ONE
